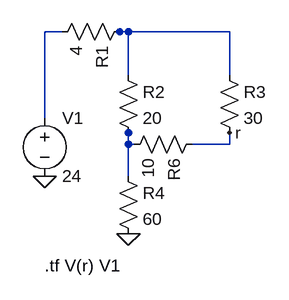
[diagram p0: schematic Ex12.asc]
Ex12.asc, the LTspice schematic file:
Version 4
SHEET 1 880 680
WIRE 60 216 60 96
WIRE 60 96 84 96
WIRE 164 96 176 96
WIRE 176 96 176 156
WIRE 164 96 316 96
WIRE 316 96 316 156
WIRE 176 236 176 296
WIRE 176 236 176 252
WIRE 176 252 184 252
WIRE 264 252 316 252
WIRE 316 252 316 236
FLAG 316 236 r
FLAG 60 296 0
FLAG 176 376 0
SYMBOL voltage 60 200 R0
SYMATTR InstName V1
SYMATTR Value 24
SYMBOL res 180 80 R90
SYMATTR InstName R1
SYMATTR Value 4
SYMBOL res 160 140 R0
SYMATTR InstName R2
SYMATTR Value 20
SYMBOL res 300 140 R0
SYMATTR InstName R3
SYMATTR Value 30
SYMBOL res 280 236 R90
SYMATTR InstName R6
SYMATTR Value 10
SYMBOL res 160 280 R0
SYMATTR InstName R4
SYMATTR Value 60
TEXT 60 420 Left 2 !.tf V(r) V1

The netlist it stands for:
* Ex12.asc
V1 N001 0 24
R1 N002 N001 4
R2 N002 N003 20
R3 N002 r 30
R6 r N003 10
R4 N003 0 60
.tf V(r) V1
.backanno
.end